# Altium schematic sheet 09_SPI_LORA.SchDoc
size A4
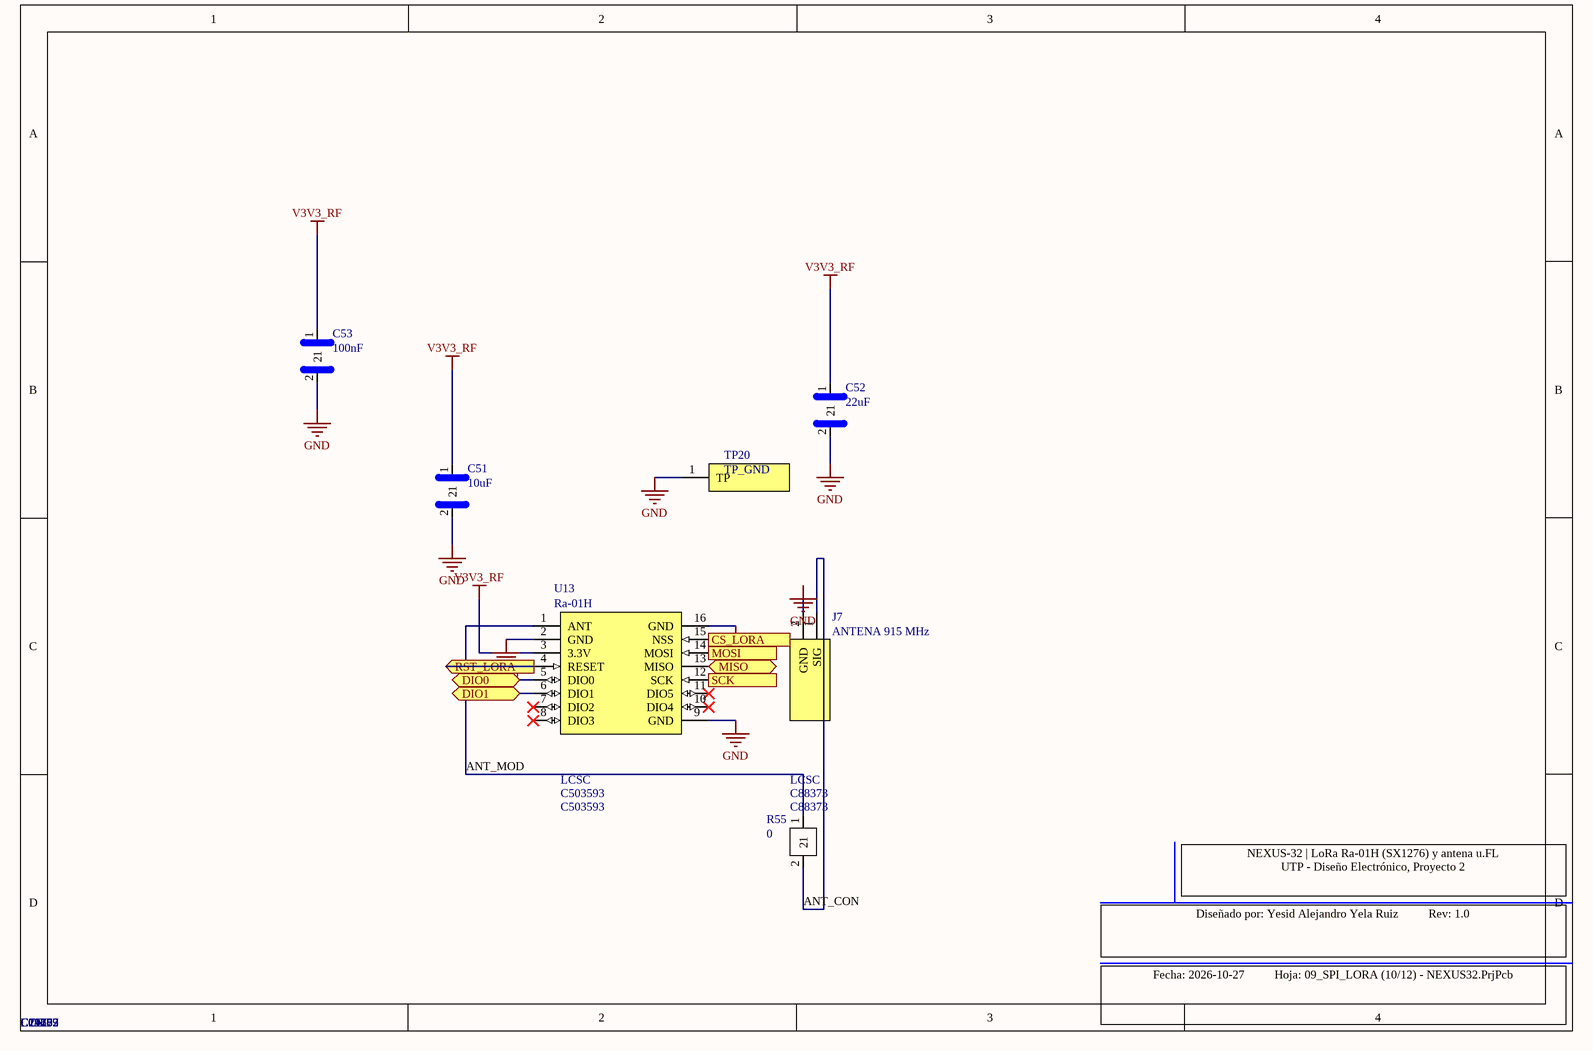
[diagram p0: 09_SPI_LORA.SchDoc]

## Parts
C51  10uF  Supplier 1: LCSC  Supplier Part Number 1: C19702  [R_0603]
C52  22uF  Supplier 1: LCSC  Supplier Part Number 1: C29277  [C_0805]
C53  100nF  Supplier 1: LCSC  Supplier Part Number 1: C14663  [R_0603]
J7  ANTENA 915 MHz  Supplier 1: LCSC  Supplier Part Number 1: C88373  [UFL_R_SMT_1]
R55  0  Supplier 1: LCSC  Supplier Part Number 1: C21189  [R_0603]
TP20  TP_GND  [TP_PAD_1.5mm]
U13  Ra-01H  Supplier 1: LCSC  Supplier Part Number 1: C503593  [MODULE_Ra-01H]

## Ports
CS_LORA (in), DIO0 (bidir), DIO1 (bidir), MISO (bidir), MOSI (in), RST_LORA (in), SCK (in)

## Nets
GND: C51.2 C52.2 C53.2 J7.2(GND) TP20.1(TP) U13.2(GND) U13.9(GND) U13.16(GND)
V3V3_RF: C51.1 C52.1 C53.1 U13.3(3.3V)
ANT_CON: J7.1(SIG) R55.2
ANT_MOD: R55.1 U13.1(ANT)
CS_LORA: U13.15(NSS) ; port CS_LORA
DIO0: U13.5(DIO0) ; port DIO0
DIO1: U13.6(DIO1) ; port DIO1
MISO: U13.13(MISO) ; port MISO
MOSI: U13.14(MOSI) ; port MOSI
RST_LORA: U13.4(RESET) ; port RST_LORA
SCK: U13.12(SCK) ; port SCK

Not connected (* = marked no-connect by the designer): U13 7(DIO2)* 8(DIO3)* 10(DIO4)* 11(DIO5)*

## Notes on the sheet
- NEXUS-32 | LoRa Ra-01H (SX1276) y antena u.FL
  UTP - Diseño Electrónico, Proyecto 2
- Diseñado por: Yesid Alejandro Yela Ruiz          Rev: 1.0
- Fecha: 2026-10-27          Hoja: 09_SPI_LORA (10/12) - NEXUS32.PrjPcb

## Library data of the parts
C51 = CAP_0603: Condensador ceramico SMD 0603; Manufacturer: Samsung; Manufacturer Part Number: CL10A106KP8NNNC; Datasheet: https://wmsc.lcsc.com/wmsc/upload/file/pdf/v2/lcsc/2206010045_UNI-ROYAL-Uniroyal-Elec-0603WAF1002T5E_C25804.pdf; LCSC Part #: C19702
C52 = CAP_0805: Condensador ceramico SMD 0805; Manufacturer: Samsung; Manufacturer Part Number: CL21A226MPQNNNE; Datasheet: https://wmsc.lcsc.com/wmsc/upload/file/pdf/v2/lcsc/2206010045_UNI-ROYAL-Uniroyal-Elec-0603WAF1002T5E_C25804.pdf; LCSC Part #: C29277
C53 = CAP_0603: Condensador ceramico SMD 0603; Manufacturer: YAGEO; Manufacturer Part Number: CC0603KRX7R9BB104; Datasheet: https://wmsc.lcsc.com/wmsc/upload/file/pdf/v2/lcsc/2206010045_UNI-ROYAL-Uniroyal-Elec-0603WAF1002T5E_C25804.pdf; LCSC Part #: C14663
J7 = UFL-R-SMT-1: Conector coaxial U.FL receptaculo SMD (Hirose U.FL-R-SMT-1(10)); 1 = senal, 2 = GND (2 pads); Manufacturer: Hirose Electric (HRS); Manufacturer Part Number: U.FL-R-SMT-1(10); LCSC Part #: C88373; Datasheet: https://wmsc.lcsc.com/wmsc/upload/file/pdf/v2/lcsc/2206010045_UNI-ROYAL-Uniroyal-Elec-0603WAF1002T5E_C25804.pdf
R55 = RES_0603: Resistencia SMD 0603; Manufacturer: UNI-ROYAL; Manufacturer Part Number: 0603WAF0000T5E; Datasheet: https://wmsc.lcsc.com/wmsc/upload/file/pdf/v2/lcsc/2206010045_UNI-ROYAL-Uniroyal-Elec-0603WAF1002T5E_C25804.pdf; LCSC Part #: C21189
TP20 = TESTPOINT: Punto de prueba, pad desnudo de 1.5mm sin montaje; Manufacturer: n/a; Manufacturer Part Number: TP_PAD_1.5mm; Datasheet: https://wmsc.lcsc.com/wmsc/upload/file/pdf/v2/lcsc/2206010045_UNI-ROYAL-Uniroyal-Elec-0603WAF1002T5E_C25804.pdf
U13 = Ra-01H: Modulo LoRa SX1276 803-930MHz SMD-16 (Ai-Thinker Ra-01H); Manufacturer: Ai-Thinker; Manufacturer Part Number: Ra-01H; LCSC Part #: C503593; Datasheet: https://wmsc.lcsc.com/wmsc/upload/file/pdf/v2/lcsc/2004022132_Ai-Thinker-Ra-01H_C503593.pdf